# Altium schematic sheet Power_Controller-Sheet.SchDoc (part 1 of 3)
size 420 x 297 mm; SheetNumber: 6; SheetTotal: 10
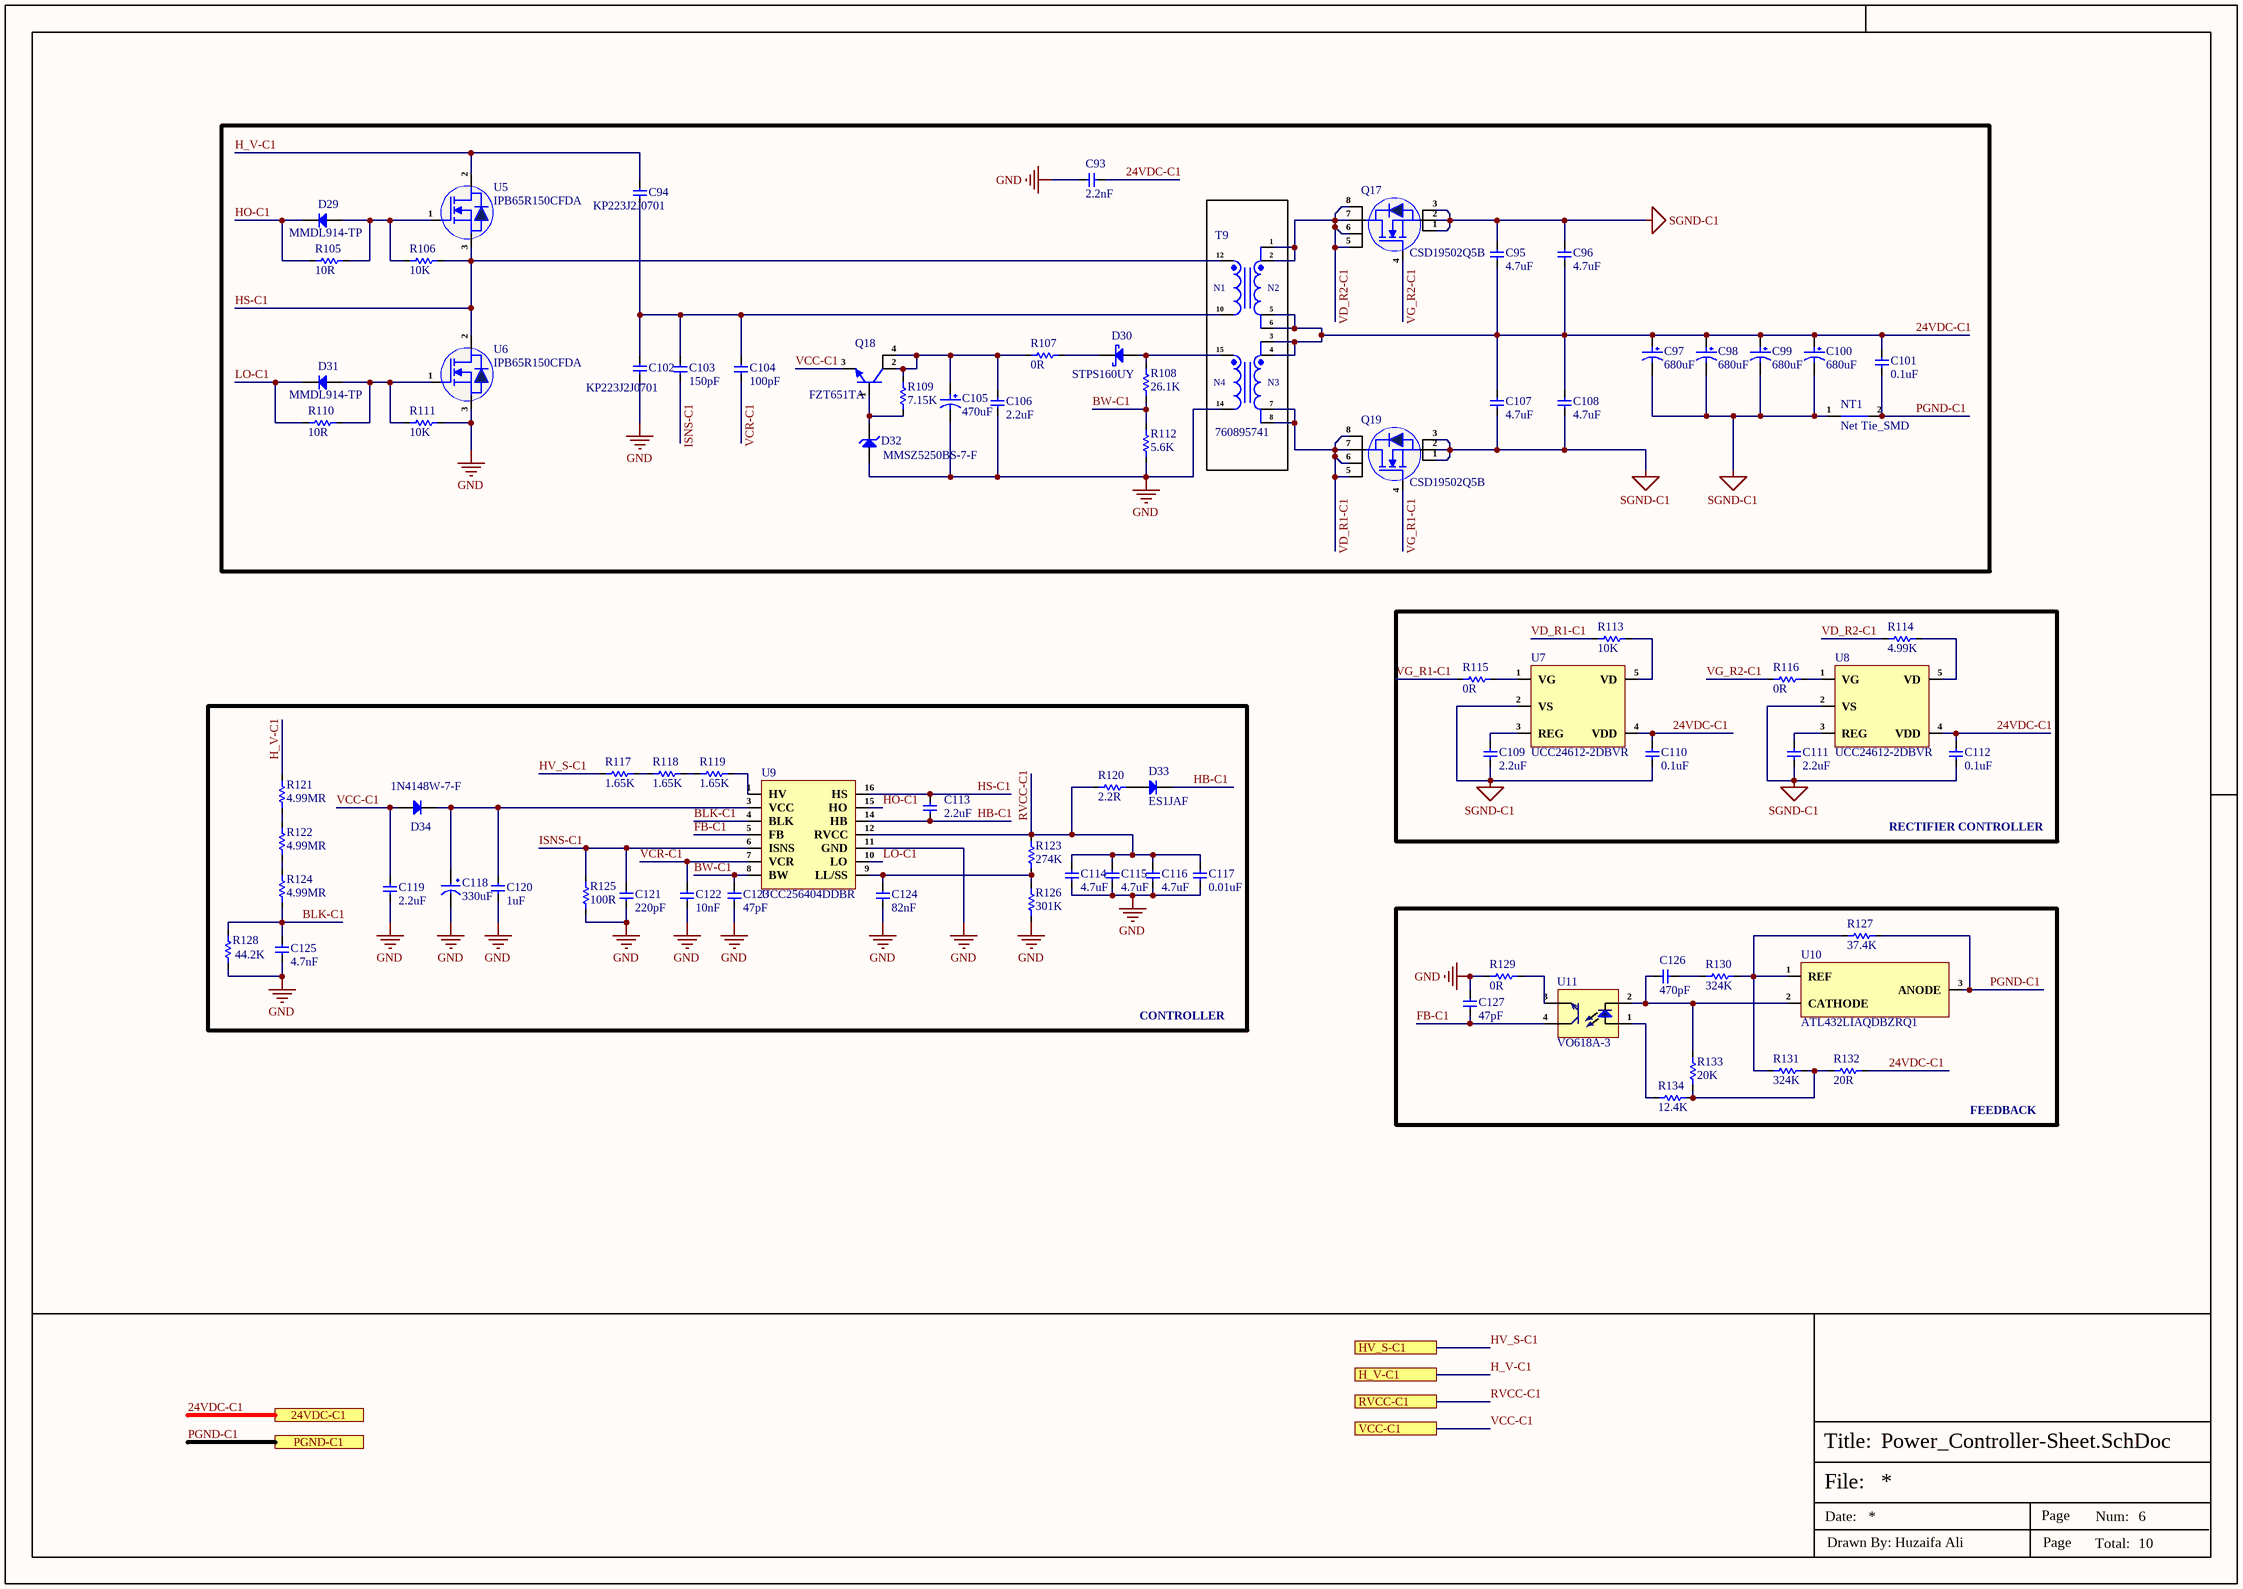
[diagram p0: Power_Controller-Sheet.SchDoc]

## Parts
C93  2.2nF  [DE1E3RA222MA4BN01F]
C94  KP223J2J0701  [KP223J2J0701]
C95  4.7uF  [Cap-1206]
C96  4.7uF  [Cap-1206]
C97  680uF  [EEU-FR1V681B]
C98  680uF  [EEU-FR1V681B]
C99  680uF  [EEU-FR1V681B]
C100  680uF  [EEU-FR1V681B]
C101  0.1uF  [Cap-1206]
C102  KP223J2J0701  [KP223J2J0701]
C103  150pF  [Cap-1206]
C104  100pF  [Cap-1206]
C105  470uF  [EEUFR1V471B]
C106  2.2uF  [Cap-1206]
C107  4.7uF  [Cap-1206]
C108  4.7uF  [Cap-1206]
C109  2.2uF  [CAP-0603]
C110  0.1uF  [Cap-1206]
C111  2.2uF  [CAP-0603]
C112  0.1uF  [Cap-1206]
C113  2.2uF  [Cap-1206]
C114  4.7uF  [Cap-0603]
C115  4.7uF  [Cap-0603]
C116  4.7uF  [Cap-0603]
C117  0.01uF  [Cap-0603]
C118  330uF  [RC035M331LO8*14TH-2A1E]
C119  2.2uF  [Cap-0603]
C120  1uF  [Cap-1206]
C121  220pF  [Cap-0603]
C122  10nF  [Cap-0603]
C123  47pF  [Cap-0402]
C124  82nF  [Cap-0603]
C125  4.7nF  [Cap-0603]
C126  470pF  [Cap-0603]
C127  47pF  [Cap-0603]
D29  MMDL914-TP  [SOD-323]
D30  STPS160UY  [SMB_]
D31  MMDL914-TP  [SOD-323]
D32  MMSZ5250BS-7-F  [SOD-323]
D33  ES1JAF  [DO-214AD (SMAF)]
D34  1N4148W-7-F  [SOD-123]
NT1  Net Tie_SMD  [Net Tie Pad]  (net tie, no BOM)
Q17  CSD19502Q5B  [VSON-CLIP-8(6x5)]
Q18  FZT651TA  [SOT- 223]
Q19  CSD19502Q5B  [VSON-CLIP-8(6x5)]
R105  10R  [Res-0603]
R106  10K  [RES-0805]
R107  0R  [Res-1206]
R108  26.1K  [Res-0603]
R109  7.15K  [Res-0603]
R110  10R  [Res-0603]
R111  10K  [RES-0805]
R112  5.6K  [RES-0805]
R113  10K  [Res-0603]
R114  4.99K  [Res-0603]
R115  0R  [Res-0402]
R116  0R  [Res-0402]
R117  1.65K  [Res-1206]
R118  1.65K  [Res-1206]
R119  1.65K  [Res-1206]
R120  2.2R  [Res-0603]
R121  4.99MR  [Res-1206]
R122  4.99MR  [Res-1206]
R123  274K  [Res-0603]
R124  4.99MR  [Res-1206]
R125  100R  [Res-0603]
R126  301K  [res-0603]
R127  37.4K  [Res-0603]
R128  44.2K  [Res-0603]
R129  0R  [Res-0603]
R130  324K  [Res-0603]
R131  324K  [Res-0603]
R132  20R  [Res-0603]
R133  20K  [Res-1206]
R134  12.4K  [Res-0603]
T9  760895741  [760895741]
U5  IPB65R150CFDA  [TO-263]
U6  IPB65R150CFDA  [TO-263]
U7  UCC24612-2DBVR  [SOT-23-5]
U8  UCC24612-2DBVR  [SOT-23-5]
U9  UCC256404DDBR  [UCC256404DDBR]
U10  ATL432LIAQDBZRQ1  [SOT-23]
U11  VO618A-3  [DIP-4]

## Blocks framed on the sheet
RECTIFIER CONTROLLER: C109-C112 R113-R116 U7 U8
CONTROLLER: C113-C125 D33 D34 R117-R126 R128 U9
FEEDBACK: C126 C127 R127 R129-R134 U10 U11

## Ports
24VDC-C1 (see Top-Sheet[3A], Connector-Sheet[1D]), H_V-C1 (see Top-Sheet[2A], PFC-Sheet[1D]), HV_S-C1 (see Top-Sheet[2A], PFC-Sheet[1D]), PGND-C1 (see Top-Sheet[3A], Connector-Sheet[1D]), RVCC-C1 (see Top-Sheet[2A], PFC-Sheet[1D]), VCC-C1 (see Top-Sheet[2A], PFC-Sheet[1D])

## Nets
GND: C93.1 C102.2 C105.2 C106.1 C114.1 C115.1 C116.1 C117.1 C118.2 C119.1 C120.2 C121.1 C122.1 C123.1 C124.1 C125.1 C127.2 D32.2(A) R111.2 R112.1 R125.1 R126.1 R128.1 R129.1 T9.14 U6.3(S) U9.11(GND)
SGND-C1: C95.2 C96.2 C97.2 C98.2 C99.2 C100.2 C107.1 C108.1 C109.1 C110.1 C111.1 C112.1 NT1.1 Q17.1(S) Q17.2(S) Q17.3(S) Q19.1(S) Q19.2(S) Q19.3(S) U7.2(VS) U8.2(VS)
24VDC-C1: C93.2 C95.1 C96.1 C97.1 C98.1 C99.1 C100.1 C101.2 C107.2 C108.2 C110.2 C112.2 R132.2 T9.3 T9.4 T9.5 T9.6 U7.4(VDD) U8.4(VDD) ; port 24VDC-C1
BLK-C1: C125.2 R124.1 R128.2 U9.4(BLK)
BW-C1: C123.2 R108.1 R112.2 U9.8(BW)
FB-C1: C127.1 U9.5(FB) U11.4(C)
H_V-C1: C94.1 R121.2 U5.2(D) ; port H_V-C1
HB-C1: C113.1 D33.1(K) U9.14(HB)
HO-C1: D29.1(K) R105.1 U9.15(HO)
HS-C1: C113.2 R106.2 T9.12 U5.3(S) U6.2(D) U9.16(HS)
HV_S-C1: R117.1 ; port HV_S-C1
ISNS-C1: C103.1 C121.2 R125.2 U9.6(ISNS)
LO-C1: D31.1(K) R110.1 U9.10(LO)
PGND-C1: C101.1 NT1.2 R127.2 U10.3(ANODE) ; port PGND-C1
RVCC-C1: C114.2 C115.2 C116.2 C117.2 R120.1 R123.2 U9.12(RVCC) ; port RVCC-C1
VCC-C1: C119.2 D34.1(A) Q18.3(E) ; port VCC-C1
VCR-C1: C104.1 C122.2 U9.7(VCR)
VD_R1-C1: Q19.5(D) Q19.6(D) Q19.7(D) Q19.8(D) R113.1 T9.7 T9.8
VD_R2-C1: Q17.5(D) Q17.6(D) Q17.7(D) Q17.8(D) R114.1 T9.1 T9.2
VG_R1-C1: Q19.4(G) R115.1
VG_R2-C1: Q17.4(G) R116.1
NetC94_2: C94.2 C102.1 C103.2 C104.2 T9.10
NetC105_1: C105.1 C106.2 Q18.2(C) Q18.4(C) R107.1 R109.2
NetC109_2: C109.2 U7.3(REG)
NetC111_2: C111.2 U8.3(REG)
NetC118_1: C118.1 C120.1 D34.2(K) U9.3(VCC)
NetC124_2: C124.2 R123.1 R126.2 U9.9(LL/SS)
NetC126_1: C126.1 R133.2 U10.2(CATHODE) U11.2(Ca)
NetC126_2: C126.2 R130.1
NetD29_2: D29.2(A) R105.2 R106.1 U5.1(G)
NetD30_1: D30.1(A) R108.2 T9.15
NetD30_2: D30.2(K) R107.2
NetD31_2: D31.2(A) R110.2 R111.1 U6.1(G)
NetD32_1: D32.1(K) Q18.1(B) R109.1
NetD33_2: D33.2(A) R120.2
NetR113_2: R113.2 U7.5(VD)
NetR114_2: R114.2 U8.5(VD)
NetR115_2: R115.2 U7.1(VG)
NetR116_2: R116.2 U8.1(VG)
NetR117_2: R117.2 R118.1
NetR118_2: R118.2 R119.1
NetR119_2: R119.2 U9.1(HV)
NetR121_1: R121.1 R122.2
NetR122_1: R122.1 R124.2
NetR127_1: R127.1 R130.2 R131.1 U10.1(REF)
NetR129_2: R129.2 U11.3(E)
NetR131_2: R131.2 R132.1 R133.1 R134.2
NetR134_1: R134.1 U11.1(An)

## Notes on the sheet
- File:
- Title:
- Date:
- Page
- Num:
- Total:
- Drawn By: Huzaifa Ali
- (in symbol 760895741) N1; N2; N4; N3